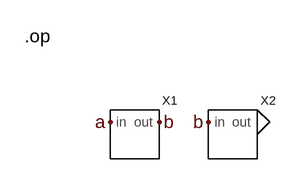
[diagram p0: schematic hierarchy.asc]
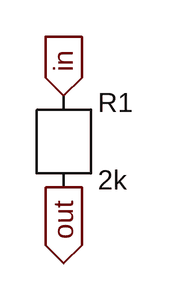
[diagram p1: sub-circuit child.asc]
hierarchy.asc, the LTspice schematic file:
Version 4
SHEET 1 800 600
FLAG 128 144 a
FLAG 192 144 b
FLAG 256 144 b
FLAG 320 144 0
SYMBOL child 128 128 R0
SYMATTR InstName X1
SYMBOL child 256 128 R0
SYMATTR InstName X2
TEXT 16 32 Left 2 !.op

child.asc, the sub-circuit schematic file:
Version 4
SHEET 1 800 600
FLAG 112 112 in
IOPIN 112 112 In
FLAG 112 192 out
IOPIN 112 192 Out
SYMBOL res 96 96 R0
SYMATTR InstName R1
SYMATTR Value 2k

The netlist it stands for:
* hierarchy.asc
XX1 a b child
XX2 b 0 child

* block symbol definitions
.subckt child in out
R1 in out 2k
.ends child

.op
.backanno
.end